# Altium schematic sheet DXES101B-659637-ANALOG-OUTPUTS.SchDoc
size A3; Organization: Altium Limited; Address1: 3 Minna Close; Address2: Belrose; Address3: NSW 2085; Address4: Australia; SheetNumber: 7; SheetTotal: 10
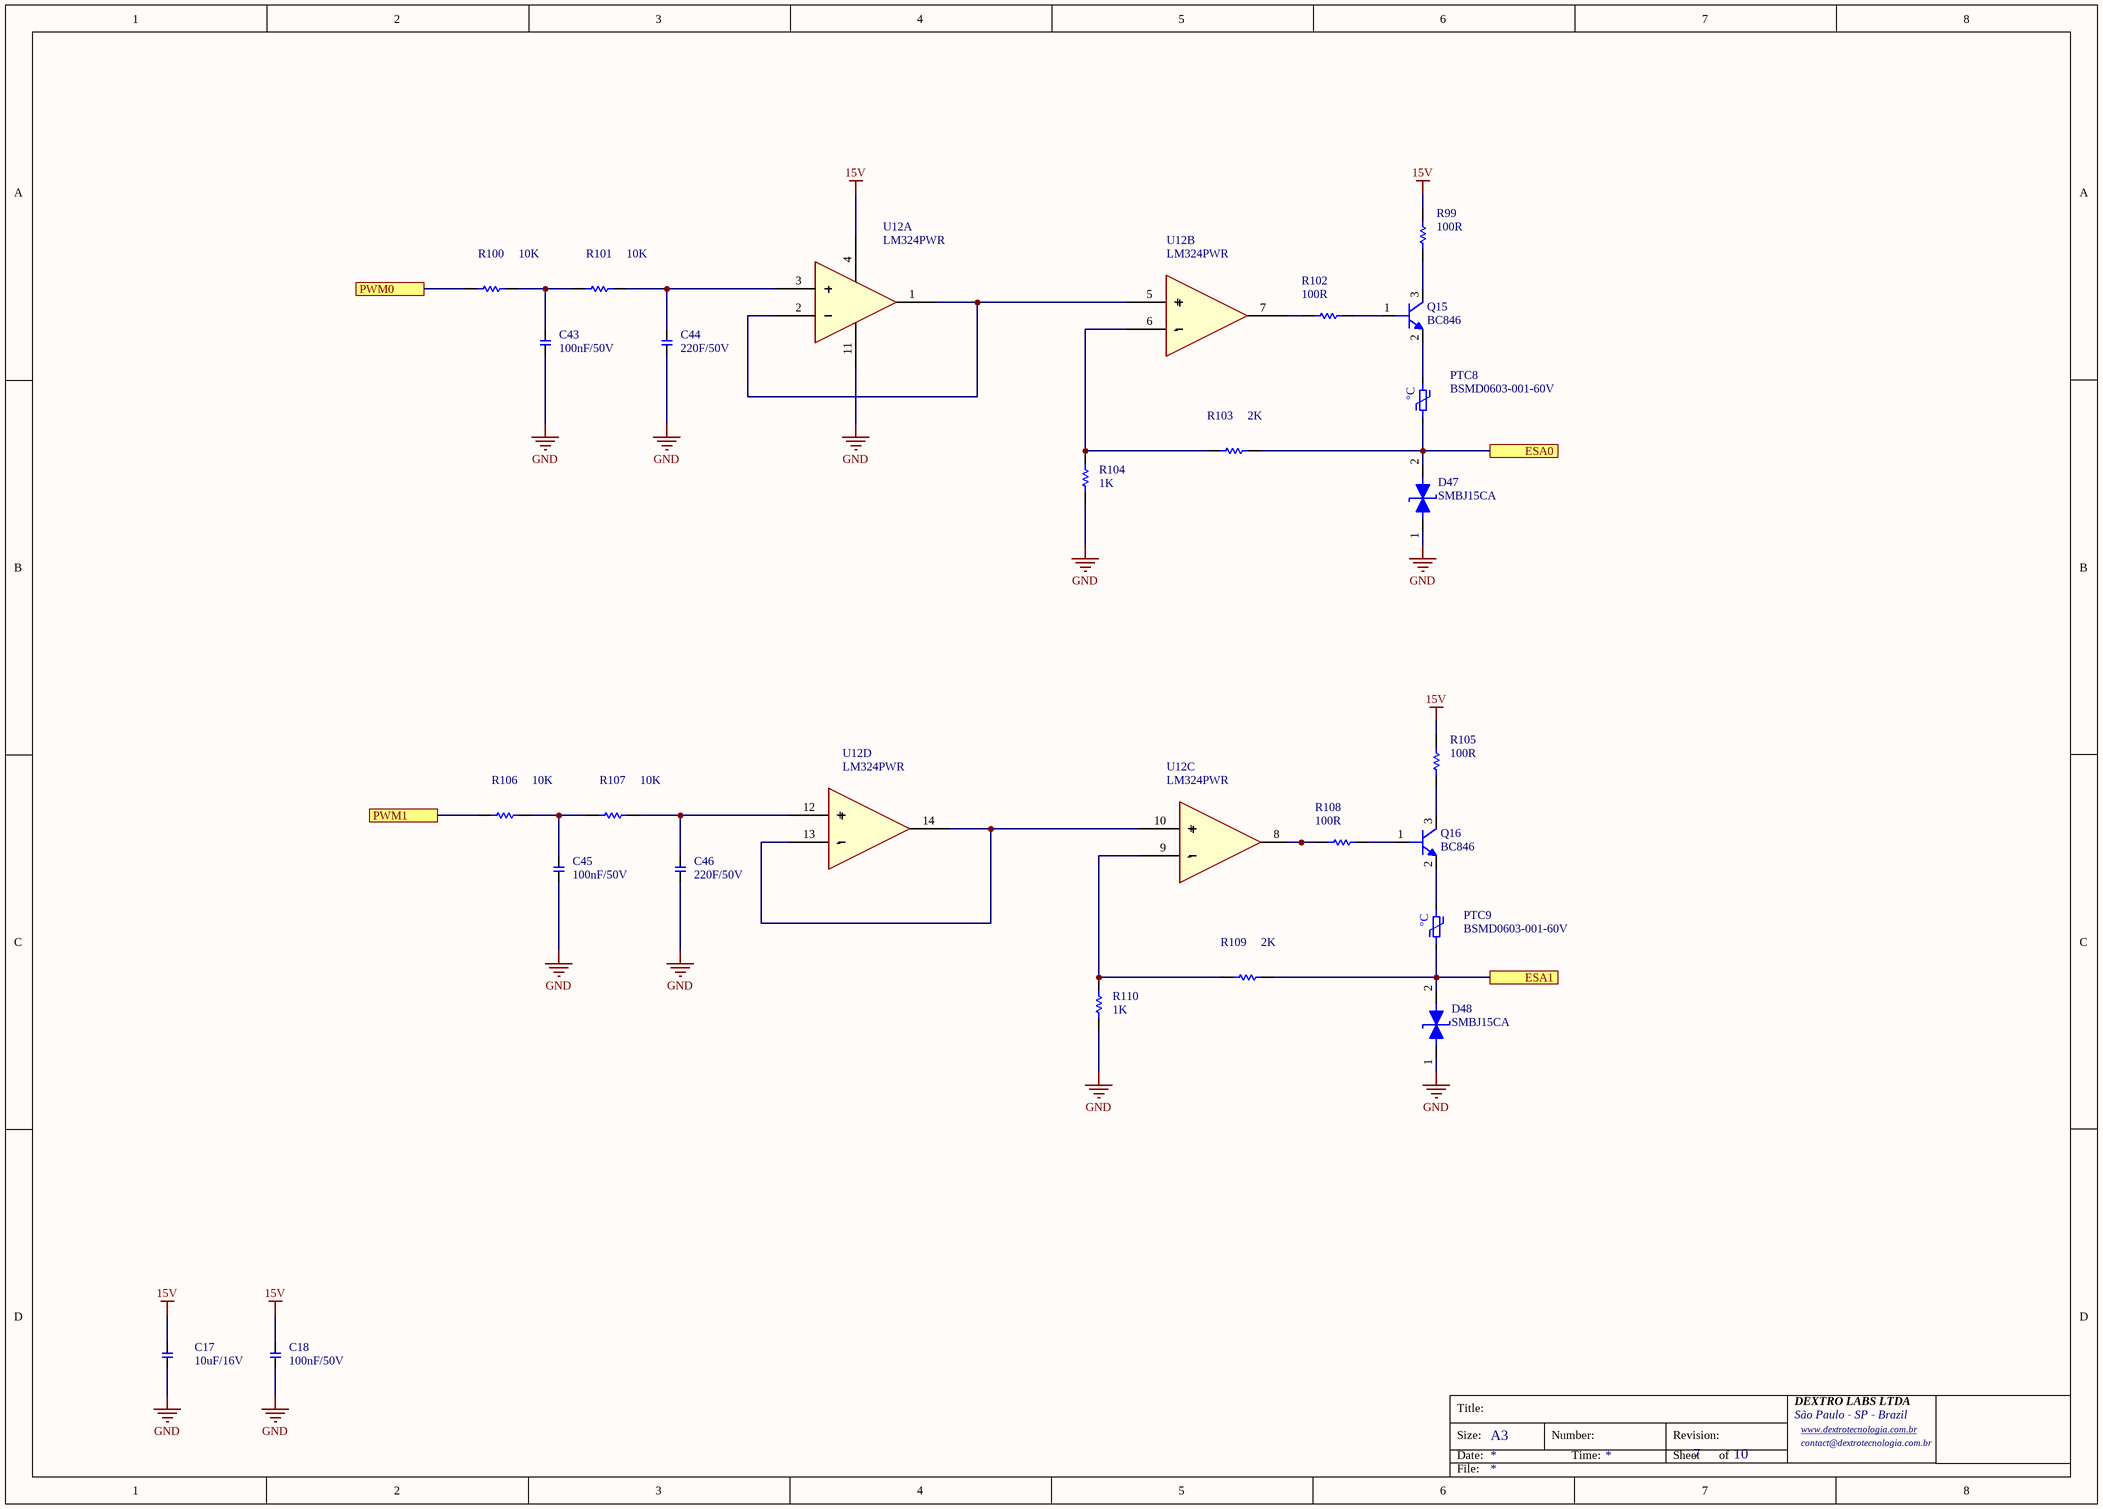
[diagram p0: DXES101B-659637-ANALOG-OUTPUTS.SchDoc]

## Parts
C17  10uF/16V  [CAP-0603]
C18  100nF/50V  [CAP-0603]
C43  100nF/50V  [CAP-0603]
C44  220F/50V  [CAP-0603]
C45  100nF/50V  [CAP-0603]
C46  220F/50V  [CAP-0603]
D47  SMBJ15CA  [DO214-AA]
D48  SMBJ15CA  [DO214-AA]
PTC8  BSMD0603-001-60V  [PTC-0603]
PTC9  BSMD0603-001-60V  [PTC-0603]
Q15  BC846  [SOT23-3]
Q16  BC846  [SOT23-3]
R99  100R  [RES-0603]
R100  10K  [RES-0603]
R101  10K  [RES-0603]
R102  100R  [RES-0603]
R103  2K  [RES-0603]
R104  1K  [RES-0603]
R105  100R  [RES-0603]
R106  10K  [RES-0603]
R107  10K  [RES-0603]
R108  100R  [RES-0603]
R109  2K  [RES-0603]
R110  1K  [RES-0603]
U12  LM324PWR  [TSSOP-14]  (parts A,B,C,D of 4)

## Ports
ESA0 (see DXES101B-659637-GENERAL[4C]), ESA1 (see DXES101B-659637-GENERAL[4C]), PWM0 (see DXES101B-659637-GENERAL[3C], DXES101B-659637-POWER-AND-SIGNALS[5C]), PWM1 (see DXES101B-659637-GENERAL[3C], DXES101B-659637-POWER-AND-SIGNALS[4C])

## Nets
15V: C17.2 C18.2 R99.2 R105.2 U12.4(VCC)
GND: C17.1 C18.1 C43.1 C44.1 C45.1 C46.1 D47.1(A1) D48.1(A1) R104.2 R110.2 U12.11(GND)
ESA0: D47.2(A2) PTC8.1 R103.2 ; port ESA0
ESA1: D48.2(A2) PTC9.1 R109.2 ; port ESA1
PWM0: R100.1 ; port PWM0
PWM1: R106.1 ; port PWM1
NetC43_2: C43.2 R100.2 R101.1
NetC44_2: C44.2 R101.2 U12.3(+)
NetC45_2: C45.2 R106.2 R107.1
NetC46_2: C46.2 R107.2 U12.12(+)
NetPTC8_2: PTC8.2 Q15.2
NetPTC9_2: PTC9.2 Q16.2
NetQ15_1: Q15.1 R102.2
NetQ15_3: Q15.3 R99.1
NetQ16_1: Q16.1 R108.2
NetQ16_3: Q16.3 R105.1
NetR102_1: R102.1 U12.7
NetR103_1: R103.1 R104.1 U12.6(-)
NetR108_1: R108.1 U12.8
NetR109_1: R109.1 R110.1 U12.9(-)
NetU12_1: U12.1 U12.2(-) U12.5(+)
NetU12_10: U12.10(+) U12.13(-) U12.14

## Notes on the sheet
- Title:
- Size:
- Date:
- A3
- Number:
- Time:
- Revision:
- Sheet
- of
- DEXTRO LABS LTDA
- São Paulo - SP - Brazil
- www.dextrotecnologia.com.br <http://www.dextrotecnologia.com.br>
- contact@dextrotecnologia.com.br
- File:
- (in symbol PTC-FUSE-60V-10mA-0603) °C

## Library data of the parts
C17 = CAP-10uF/16V-0603-X5R: 16V 10uF X5R ±20% 0603 Multilayer Ceramic Capacitors MLCC - SMD/SMT ROHS; LCSC: C92487
C18 C43 C45 = CAP-100nF/50V-0603-X7R-MLCC: 50V 100nF X7R ±10% 0603 Multilayer Ceramic Capacitors MLCC - SMD/SMT ROHS; LCSC: C14663
C44 C46 = CAP-22nF/50V-0603-X7R-MLCC: 50V 22nF X7R ±10% 0603 Ceramic Capacitors ROHS; LCSC: C1589
D47 D48 = SMBJ15CA: 24.6A 600W@8/20us 24.4V 19.2V Bidirectional 15V SMB(DO-214AA) ESD and Surge Protection (TVS/ESD) ROHS; LCSC: C2760879
PTC8 PTC9 = PTC-FUSE-60V-10mA-0603: 60V 10mA 20A 50mA 15Ω 0603 PTC Resettable Fuses ROHS; LCSC: C914088
Q15 Q16 = TRANSISTOR-BC846B,215-SOT23: 65V 200@10mA,5V 250mW 100mA NPN SOT-23 Bipolar (BJT) ROHS; LCSC: C87062
R99 R102 R105 R108 = RES-100R-1%-100mW-0603: 100mW Thick Film Resistor 75V ±100ppm/℃ ±1% 100Ω 0603 Chip Resistor - Surface Mount ROHS; LCSC: C105588
R100 R101 R106 R107 = RES-10K-1%-100mW-0603: 100mW Thick Film Resistor 75V ±100ppm/℃ ±1% 10kΩ 0603 Chip Resistor - Surface Mount ROHS; LCSC: C98220
R103 R109 = RES-2K-1%-100mW-0603: 100mW Thick Film Resistor 75V ±100ppm/℃ ±2% 1kΩ 0603 Chip Resistor - Surface Mount ROHS; LCSC: C22975
R104 R110 = RES-1K-1%-100mW-0603: 100mW Thick Film Resistor 75V ±100ppm/℃ ±1% 1kΩ 0603 Chip Resistor - Surface Mount ROHS; LCSC: C22548
U12 = LM324PWR: Quad 20nA 0.5V/us 1.2MHz TSSOP-14 Operational Amplifier ROHS; LCSC: C7942